# Altium schematic sheet Sheet1-BeforeClearParameters-20261027_155718_051.SchDoc (part 1 of 3)
size A3; SheetNumber: 1; SheetTotal: 1
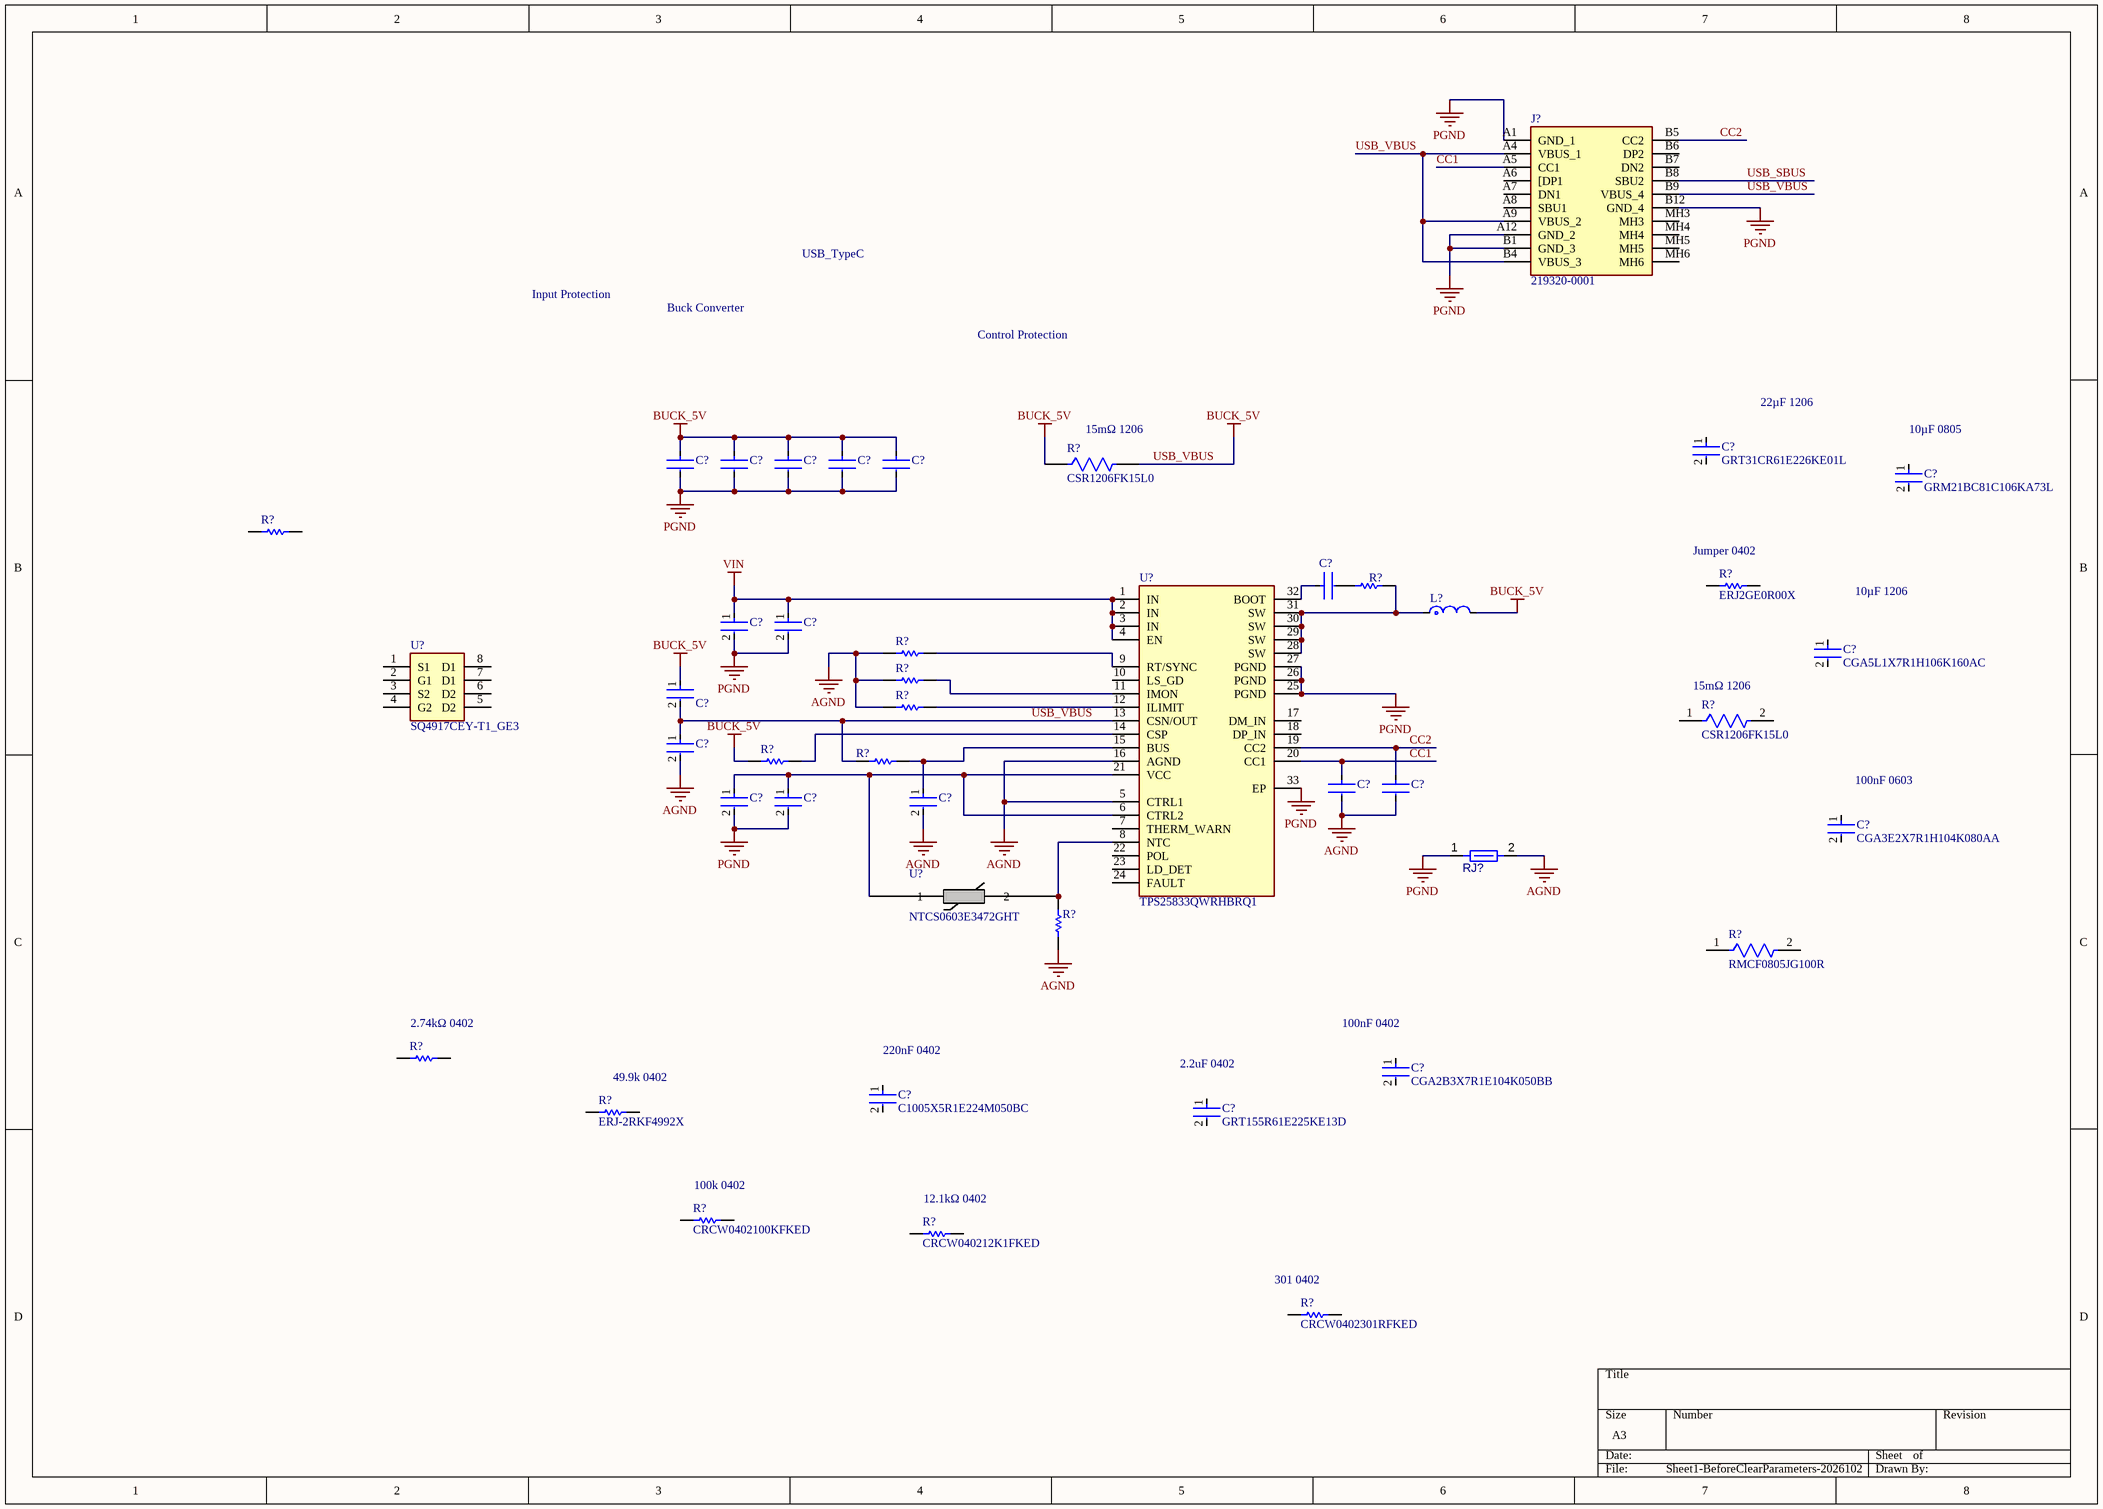
[diagram p0: Sheet1-BeforeClearParameters-20261027_155718_051.SchDoc]

## Parts
(Parts that share a designator on the sheet are numbered #1, #2 ... from top to bottom, then left to right.)
C?#1  GRT31CR61E226KE01L  [FP-CGA5L-0_3-0_1-MFG]
C?#2  GRT31CR61E226KE01L  [FP-CGA5L-0_3-0_1-MFG]  (value not drawn)
C?#3  GRT31CR61E226KE01L  [FP-CGA5L-0_3-0_1-MFG]  (value not drawn)
C?#4  GRT31CR61E226KE01L  [FP-CGA5L-0_3-0_1-MFG]  (value not drawn)
C?#5  GRT31CR61E226KE01L  [FP-CGA5L-0_3-0_1-MFG]  (value not drawn)
C?#6  GRT31CR61E226KE01L  [FP-CGA5L-0_3-0_1-MFG]  (value not drawn)
C?#7  GRM21BC81C106KA73L  [FP-GRM21B-0_15-MFG]
C?#8  CGA3E2X7R1H104K080AA  [FP-CGA3E-0_3-0_1-IPC_A]  (value not drawn)
C?#9  CGA5L1X7R1H106K160AC  [FP-CGA5L-0_3-0_1-MFG]  (value not drawn)
C?#10  CGA3E2X7R1H104K080AA  [FP-CGA3E-0_3-0_1-IPC_A]  (value not drawn)
C?#11  CGA5L1X7R1H106K160AC  [FP-CGA5L-0_3-0_1-MFG]
C?#12  CGA3E2X7R1H104K080AA  [FP-CGA3E-0_3-0_1-IPC_A]  (value not drawn)
C?#13  CGA3E2X7R1H104K080AA  [FP-CGA3E-0_3-0_1-IPC_A]  (value not drawn)
C?#14  C1005X5R1E224M050BC  [FP-CGA2B-IPC_B]  (value not drawn)
C?#15  C1005X5R1E224M050BC  [FP-CGA2B-IPC_B]  (value not drawn)
C?#16  GRT155R61E225KE13D  [FP-CGA2B-IPC_B]  (value not drawn)
C?#17  CGA2B3X7R1E104K050BB  [FP-CGA2B-IPC_B]  (value not drawn)
C?#18  C1005X5R1E224M050BC  [FP-CGA2B-IPC_B]  (value not drawn)
C?#19  CGA3E2X7R1H104K080AA  [FP-CGA3E-0_3-0_1-IPC_A]
C?#20  CGA2B3X7R1E104K050BB  [FP-CGA2B-IPC_B]
C?#21  C1005X5R1E224M050BC  [FP-CGA2B-IPC_B]
C?#22  GRT155R61E225KE13D  [FP-CGA2B-IPC_B]
J?  219320-0001  [2193200001]
L?  XAL6060-103MEB  [FP-XAL6060-MFG]  (value not drawn)
R?#1  CSR1206FK15L0  [FP-CSR1206-IPC_B]
R?#2  (no value)  [RESC1005X40X25LL05T05]
R?#3  ERJ2GE0R00X  [RESC1005X40X25LL05T05]  (value not drawn)
R?#4  ERJ2GE0R00X  [RESC1005X40X25LL05T05]
R?#5  ERJ-2RKF4992X  [RESC1005X40X25LL05T05]  (value not drawn)
R?#6  ERJ2GE0R00X  [RESC1005X40X25LL05T05]  (value not drawn)
R?#7  CRCW040211K8FKEE  [RESC1005X40X25LL05T05]  (value not drawn)
R?#8  CSR1206FK15L0  [FP-CSR1206-IPC_B]
R?#9  SG73P2ATTD1000F  [RESC2013X60X30ML20T20]  (value not drawn)
R?#10  CRCW0402301RFKED  [RESC1005X40X25LL05T05]  (value not drawn)
R?#11  (no value)  [RESC1005X40X25LL05T05]
R?#12  RMCF0805JG100R  [FP-RMCF0805-MFG]
R?#13  (no value)  [RESC1005X40X25LL05T05]
R?#14  ERJ-2RKF4992X  [RESC1005X40X25LL05T05]
R?#15  CRCW0402100KFKED  [RESC1005X40X25LL05T05]
R?#16  CRCW040212K1FKED  [RESC1005X40X25LL05T05]
R?#17  CRCW0402301RFKED  [RESC1005X40X25LL05T05]
RJ?  Net Tie 0.6x1.4mm  [SHORT10_8MIL-FP]  (value not drawn)  (net tie, no BOM)
U?#1  SQ4917CEY-T1_GE3  [FP-C04-057-SN-MFG]
U?#2  NTCS0603E3472GHT  [NTCS0603_VIS]
U?#3  TPS25833QWRHBRQ1  [FP-RHB0032D-IPC_A]

## Nets
AGND: C?#13.2 C?#14.2 C?#15.2 C?#18.2 R?#5.1 R?#6.1 R?#7.1 R?#11.1 RJ?.2 U?#3.5(CTRL1) U?#3.16(AGND)
PGND: C?#2.2 C?#3.2 C?#4.2 C?#5.2 C?#6.2 C?#9.2 C?#10.2 C?#16.2 C?#17.2 J?.A1(GND_1) J?.A12(GND_2) J?.B1(GND_3) J?.B12(GND_4) RJ?.1 U?#3.25(PGND) U?#3.26(PGND) U?#3.27(PGND) U?#3.33(EP)
USB_VBUS: C?#2.1 C?#3.1 C?#4.1 C?#5.1 C?#6.1 C?#12.1 C?#12.2 C?#13.1 J?.A4(VBUS_1) J?.A9(VBUS_2) J?.B4(VBUS_3) J?.B9(VBUS_4) L?.2 R?#1.1 R?#1.2 R?#9.1 R?#10.1 U?#3.13(CSN/OUT)  [also labelled BUCK_5V]
VIN: C?#9.1 C?#10.1 U?#3.1(IN) U?#3.2(IN) U?#3.3(IN) U?#3.4(EN)
CC1: C?#14.1 J?.A5(CC1) U?#3.20(CC1)
CC2: C?#15.1 J?.B5(CC2) U?#3.19(CC2)
USB_SBUS: J?.B8(SBU2)
NetC?#8_1: C?#8.1 U?#3.32(BOOT)
NetC?#8_2: C?#8.2 R?#3.1
NetC?#16_1: C?#16.1 C?#17.1 U?#2.1 U?#3.6(CTRL2) U?#3.21(VCC)
NetC?#18_1: C?#18.1 R?#9.2 U?#3.15(BUS)
NetL?_1: L?.1 R?#3.2 U?#3.28(SW) U?#3.29(SW) U?#3.30(SW) U?#3.31(SW)
NetR?#5_2: R?#5.2 U?#3.9(RT/SYNC)
NetR?#6_2: R?#6.2 U?#3.11(IMON)
NetR?#7_2: R?#7.2 U?#3.12(ILIMIT)
NetR?#10_2: R?#10.2 U?#3.14(CSP)
NetR?#11_2: R?#11.2 U?#2.2 U?#3.8(NTC)

Not connected (* = marked no-connect by the designer): C?#1 1 2; C?#7 1 2; C?#11 1 2; C?#19 1 2; C?#20 1 2; C?#21 1 2; C?#22 1 2; J? A6([DP1) A7(DN1) A8(SBU1) B6(DP2) B7(DN2) MH3 MH4 MH5 MH6; R?#2 1 2; R?#4 1 2; R?#8 1 2; R?#12 1 2; R?#13 1 2; R?#14 1 2; R?#15 1 2; R?#16 1 2; R?#17 1 2; U?#1 1(S1) 2(G1) 3(S2) 4(G2) 5(D2) 6(D2) 7(D1) 8(D1); U?#3 7(THERM_WARN) 10(LS_GD) 17(DM_IN) 18(DP_IN) 22(POL) 23(LD_DET) 24(FAULT)

## Notes on the sheet
- Input Protection
- Buck Converter
- USB_TypeC
- Control Protection
- (near R?#1) 15mΩ 1206
- 22µF 1206
- (near C?#7) 10µF 0805
- (near R?#4) Jumper 0402
- 10µF 1206
- (near R?#8) 15mΩ 1206
- (near C?#19) 100nF 0603
- (near R?#13) 2.74kΩ 0402
- (near C?#21) 220nF 0402
- (near C?#20) 100nF 0402
- (near R?#14) 49.9k 0402
- (near C?#22) 2.2uF 0402
- (near R?#15) 100k 0402
- (near R?#16) 12.1kΩ 0402
- (near R?#17) 301 0402